# EasyEDA Pro project 2023新生开发板（小组）.eprj, board PCB2
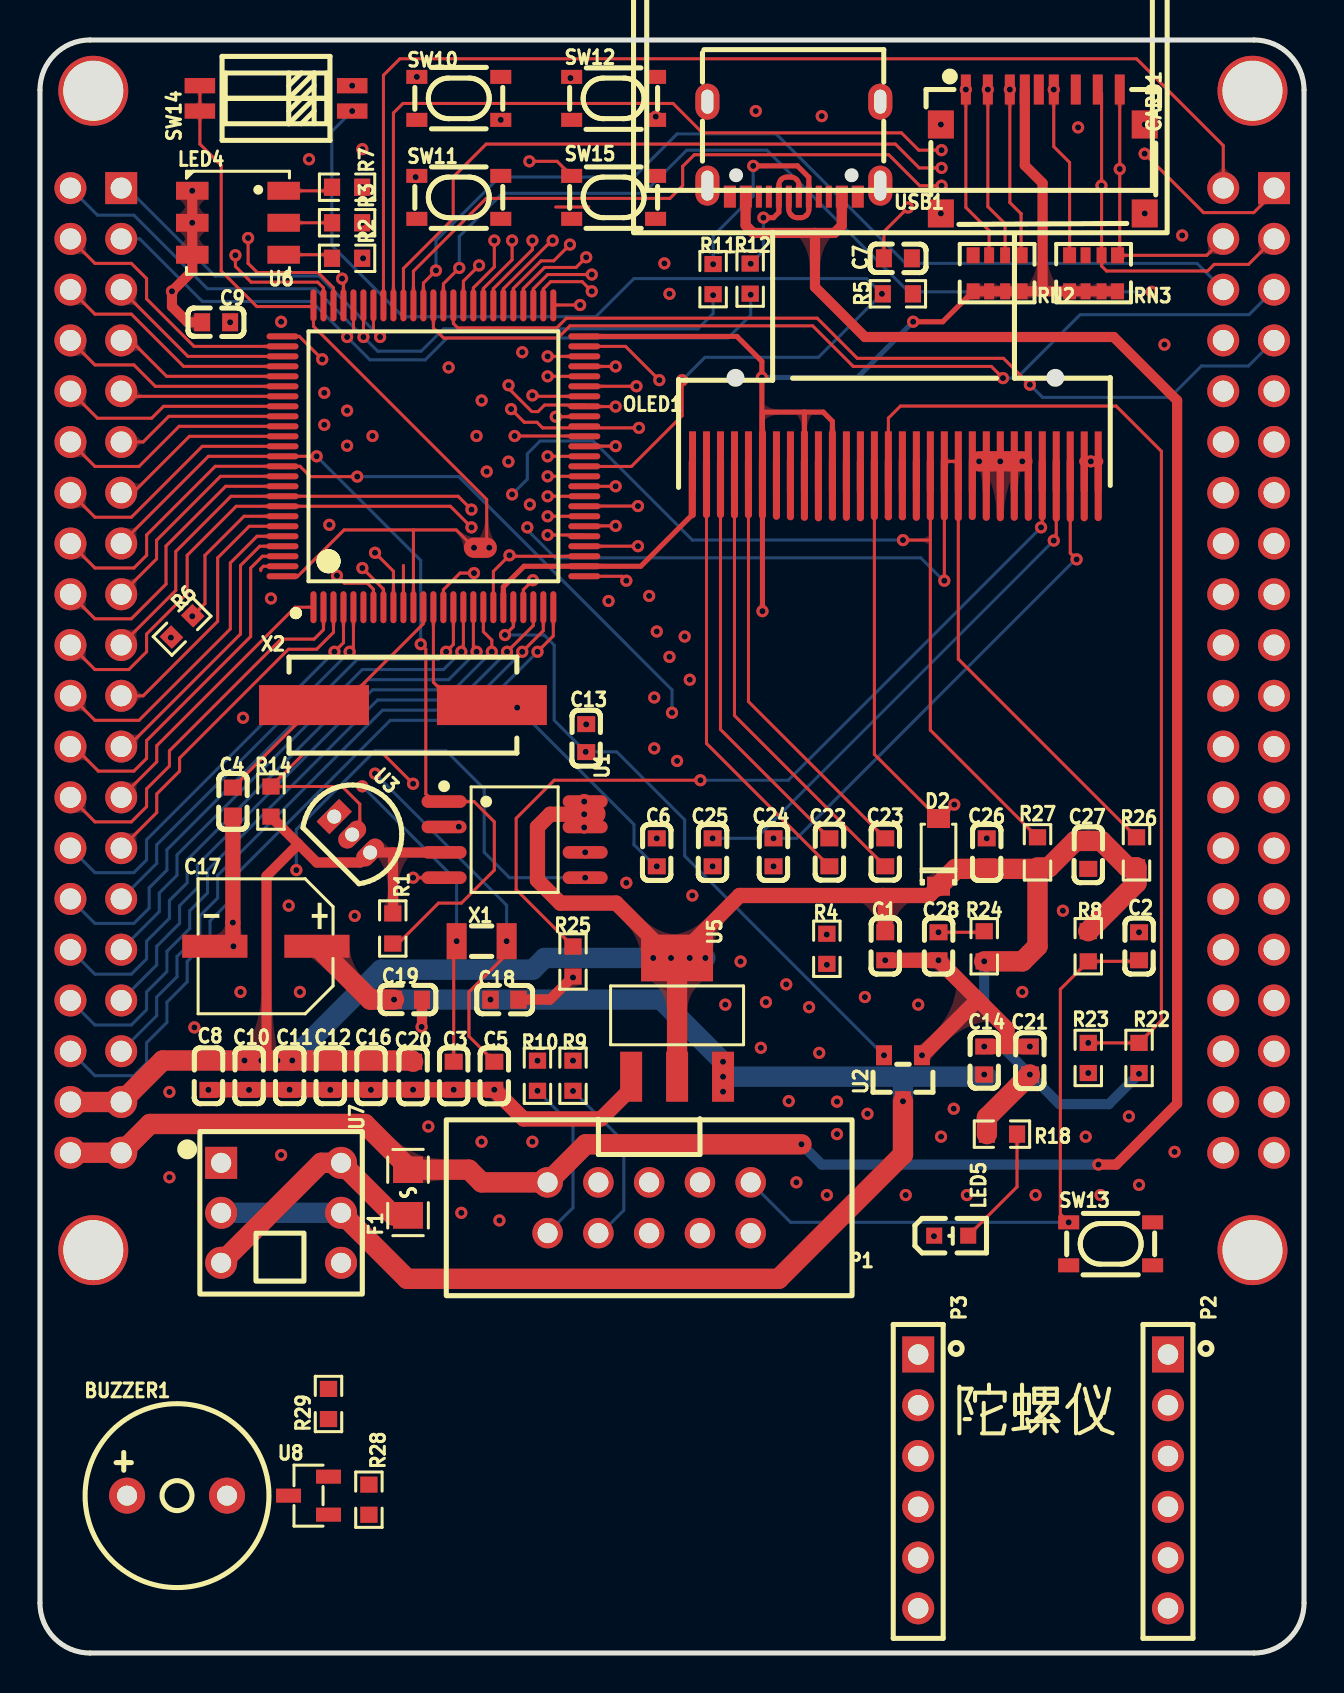
[diagram p2: board, top side]
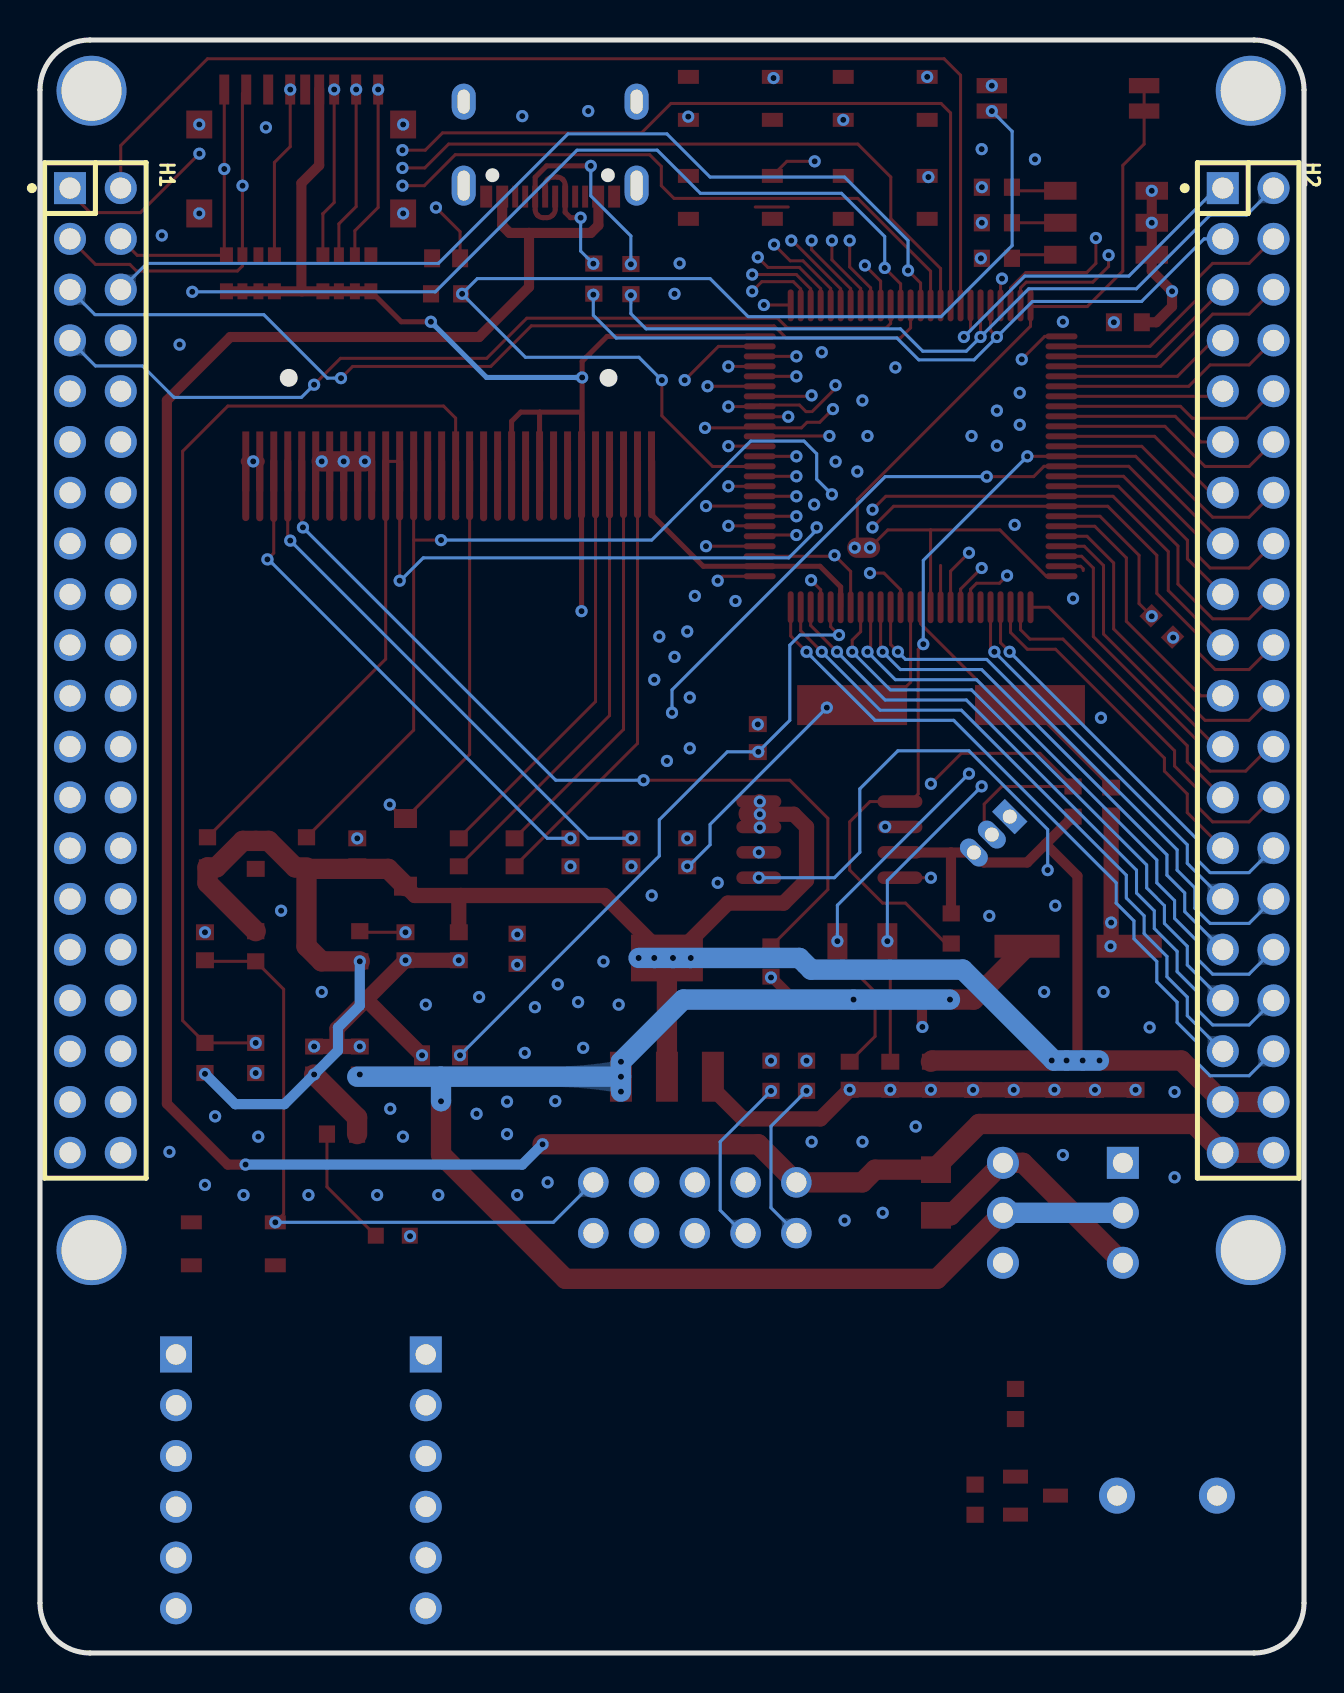
[diagram p3: board, bottom side, seen from below]

Outline 63.25 x 80.7 mm; copper layers: Top Layer, Inner1, Inner2, Bottom Layer. Coordinates in mm from the lower left corner of the outline.
Outline path: 0,78.2 0,2.5 arc(0.73,0.73) 2.5,0 60.75,0 arc(62.51,0.73) 63.25,2.5 63.25,78.2 arc(62.51,79.96) 60.75,80.7 2.5,80.7 arc(0.73,79.96) 0,78.2
Stack: Top Layer 0.035mm 外层铜厚1oz / Dielectric1 0.2104mm 7628 RC49% 8.6mil / Inner1 0.0152mm 内层铜厚 / Dielectric2 1.065mm 1.1mm H/HOZ 含铜 / Inner2 0.0152mm 内层铜厚 / Dielectric3 0.2104mm 7628 RC49% 8.6mil / Bottom Layer 0.035mm 外层铜厚1oz

## Design rules (mm)
template: JLCPCB Capability(Two Layers Board)
spacing copperThickness1oz (default): track to track 0.102, other pairs 0.152 to 0.3
spacing copperThickness2oz: track to track 0.203, other pairs 0.152 to 0.3
track width copperThickness1oz (default): min 0.127, default 0.254, max 2.54
track width copperThickness2oz: min 0.203, default 0.254, max 2.54
differential pair differentialPair (default): width min 0.127, default 0.254, max 2.54; gap min 0.152, default 0.152
via viaSize (default): diameter min 0.5, default 0.61, max 10; hole min 0.3, default 0.305, max 6.3

## Placement (name value [footprint] x y rotation side)
BUZZER1  3kHz  [BUZ-TH_BD9.0-P5.00-D0.6-FD]  6.86 7.87 0 top
C1  100nF  [C0603]  42.29 35.36 270 top
C2  100nF  [C0603]  54.99 35.36 270 top
C3  12pF  [C0603]  20.7 28.88 90 top
C4  20pF  [C0603]  9.65 42.6 270 top
C5  12pF  [C0603]  22.73 28.88 90 top
C6  20pF  [C0603]  30.86 40.06 90 top
C7  1uF  [C0603]  42.93 69.77 180 top
C8  100nF  [C0603]  8.43 28.87 270 top
C9  1uF  [C0603]  8.81 66.57 0 top
C10  100nF  [C0603]  10.46 28.87 270 top
C11  100nF  [C0603]  12.49 28.87 270 top
C12  100nF  [C0603]  14.53 28.87 270 top
C13  100nF  [C0603]  27.33 45.77 90 top
C14  1uF  [C0603]  47.24 29.64 270 top
C16  100nF  [C0603]  16.56 28.87 270 top
C17  220uF  [CAP-SMD_BD6.3-L6.6-W6.6-LS7.2-R-RD]  11.3 35.36 0 top
C18  1uF  [C0603]  23.24 32.69 180 top
C19  100nF  [C0603]  18.41 32.69 0 top
C20  1uF  [C0603]  18.67 28.88 90 top
C21  100nF  [C0603]  49.53 29.64 90 top
C22  1uF  [C0603]  39.5 40.06 270 top
C23  1uF  [C0603]  42.29 40.06 270 top
C24  2.2uF  [C0603]  36.7 40.06 90 top
C25  4.7uF  [C0603]  33.66 40.06 90 top
C26  1uF  [C0603]  47.37 40.06 90 top
C27  1uF  [C0603]  52.45 39.93 270 top
C28  4.7uF  [C0603]  44.96 35.36 270 top
CARD1  XKTF-0803-0  [TF-SMD_XKTF-0803-0]  50.18 75.12 180 top
D2  1N4148W  [SOD-123_L2.8-W1.8-LS3.7-RD]  44.96 40.06 90 top
F1  BSMD0805-020-30V  [F0805]  18.41 23.04 90 top
H1  X6521WV-2x20H-C60D30  [HDR-TH_40P-2.54-V-M-R2-C20-S2.54]  60.47 49.16 270 bottom
H2  X6521WV-2x20H-C60D30  [HDR-TH_40P-2.54-V-M-R2-C20-S2.54]  2.79 49.16 270 bottom
LED4  MHP5050RGBDT  [LED-ARRAY-SMD_6P-L5.0-W5.0-TR-RD]  9.91 71.55 0 top
LED5  NCD0603R3  [LED0603-R-RD_RED]  45.59 20.88 0 top
NOREF  -  [Pad_e168]  60.67 20.16 0 top
NOREF#2  -  [Pad_e167]  60.67 78.16 0 top
NOREF#3  -  [Pad_e166]  2.67 20.16 0 top
NOREF#4  -  [Pad_e164]  2.67 78.16 0 top
OLED1  N096-2864KSWEG01-H30  [OLED_0.96-30P-P0.70-12864]  42.8 59.61 0 top
P1  2.54-2*5P简牛  [IDC-TH_10P-P2.54_C5665]  30.48 22.28 180 top
P2  2.54-1*6P母  [HDR-TH_6P-P2.54-V-F]  56.44 8.59 270 top
P3  2.54-1*6P母  [HDR-TH_6P-P2.54-V-F]  43.94 8.59 270 top
R1  10kΩ  [R0603]  17.65 36.25 270 top
R2  220Ω  [R0603]  15.37 69.77 180 top
R3  220Ω  [R0603]  15.37 71.55 180 top
R4  20Ω  [R0603]  39.37 35.23 90 top
R5  10kΩ  [R0603]  42.93 68 0 top
R6  10kΩ  [R0603]  7.11 51.36 225 top
R7  470Ω  [R0603]  15.37 73.33 180 top
R8  10kΩ  [R0603]  52.45 35.36 270 top
R9  20Ω  [R0603]  26.67 28.88 90 top
R10  20Ω  [R0603]  24.89 28.88 270 top
R11  20Ω  [R0603]  33.68 68.73 90 top
R12  20Ω  [R0603]  35.53 68.76 90 top
R14  10K  [R0603]  11.56 42.6 270 top
R18  470Ω  [R0603]  48.13 25.96 0 top
R22  4.7K  [R0603]  54.99 29.77 270 top
R23  4.7K  [R0603]  52.45 29.77 90 top
R24  4.7K  [R0603]  47.24 35.36 270 top
R25  910K  [R0603]  26.67 34.59 90 top
R26  4.7K  [R0603]  54.86 40.06 90 top
R27  4.7K  [R0603]  49.91 40.06 90 top
R28  4.7K  [R0603]  16.46 7.67 270 top
R29  10K  [R0603]  14.44 12.46 90 top
RN2  10kΩ  [RES-ARRAY-SMD_0603-8P-L3.2-W1.6-BL]  47.89 69.02 0 top
RN3  10kΩ  [RES-ARRAY-SMD_0603-8P-L3.2-W1.6-BL]  52.72 69.02 0 top
SW10  SKRPACE010  [KEY-SMD_4P-L4.2-W3.2-P2.20-LS4.6]  20.96 77.78 180 top
SW11  SKRPACE010  [KEY-SMD_4P-L4.2-W3.2-P2.20-LS4.6]  20.96 72.82 0 top
SW12  SKRPACE010  [KEY-SMD_4P-L4.2-W3.2-P2.20-LS4.6]  28.7 77.78 0 top
SW13  SKRPACE010  [KEY-SMD_4P-L4.2-W3.2-P2.20-LS4.6]  53.57 20.47 0 top
SW14  DSHP02TSGET  [SW-SMD_4P_DSHP02TSGET]  11.81 77.78 90 top
SW15  SKRPACE010  [KEY-SMD_4P-L4.2-W3.2-P2.20-LS4.6]  28.7 72.82 0 top
U1  W25Q16JVSSIQ  [SOIC-8_L5.3-W5.3-P1.27-LS8.0-BL]  23.75 40.69 270 top
U2  PJ75AL33SA  [SOT-23_L2.9-W1.3-P1.90-LS2.4-BR]  43.18 28.75 90 top
U3  DS18B20  [TO-92-3_L4.9-W3.7-P1.27-L]  15.62 40.95 315 top
U5  AMS1117-3.3  [SOT-223-3_L6.5-W3.4-P2.30-LS7.0-BR]  31.88 31.8 270 top
U6  STM32F407VET6  [LQFP-100_L14.0-W14.0-P0.50-LS16.0-BL]  19.69 59.87 0 top
U7  PB-22E08  [SW-TH_6P-L8.0-W8.0-P2.50_PB-22E08]  12.06 22.02 270 top
U8  SS8050  [SOT-23-3_L2.9-W1.3-P1.90-LS2.4-BR]  13.44 7.87 0 top
USB1  TYPE-C 16PIN 2MD(073)  [USB-C-SMD_TYPE-C-6PIN-2MD-073]  37.72 75.23 180 top
X1  32.768kHz  [FC-135R_L3.2-W1.5]  22.1 35.61 180 top
X2  8MHz  [CRYSTAL-SMD_L11.5-W4.8-LS12.7]  18.16 47.42 0 top

## Footprints (pads in the part's own frame, mm; a bottom-side part is the same pattern mirrored in y, then rotated)
BUZ-TH_BD9.0-P5.00-D0.6-FD
  round 1.8 hole 1: 1(-2.5,0) 2(2.5,0)
C0603
  rect 0.8x0.9 smd: 1(-0.7,0) 2(0.7,0)
CAP-SMD_BD6.3-L6.6-W6.6-LS7.2-R-RD
  rect 3.26x1.15 smd: 1(2.555,0) 2(-2.555,0)
CRYSTAL-SMD_L11.5-W4.8-LS12.7
  rect 5.5x2 smd: 1(-4.45,0) 2(4.45,0)
F0805
  rect 1.335x1.5 smd: 1(-1.143,0) 2(1.143,0)
FC-135R_L3.2-W1.5
  rect 1x1.8 smd: 1(-1.25,0) 2(1.25,0)
HDR-TH_6P-P2.54-V-F
  rect 1.8x1.6 hole 1.02: 1(-6.35,0)
  round 1.6 hole 1.02: 2(-3.81,0) 3(-1.27,0) 4(1.27,0) 5(3.81,0) 6(6.35,0)
HDR-TH_40P-2.54-V-M-R2-C20-S2.54
  rect 1.6x1.6 hole 1.05: 1(-24.13,-1.27)
  round 1.6 hole 1.05: 2(-24.13,1.27) 3(-21.59,-1.27) 4(-21.59,1.27) 5(-19.05,-1.27) 6(-19.05,1.27) 7(-16.51,-1.27) 8(-16.51,1.27) 9(-13.97,-1.27) 10(-13.97,1.27) 11(-11.43,-1.27) 12(-11.43,1.27) 13(-8.89,-1.27) 14(-8.89,1.27) 15(-6.35,-1.27) 16(-6.35,1.27) 17(-3.81,-1.27) 18(-3.81,1.27) 19(-1.27,-1.27) 20(-1.27,1.27) 21(1.27,-1.27) 22(1.27,1.27) 23(3.81,-1.27) 24(3.81,1.27) 25(6.35,-1.27) 26(6.35,1.27) 27(8.89,-1.27) 28(8.89,1.27) 29(11.43,-1.27) 30(11.43,1.27) 31(13.97,-1.27) 32(13.97,1.27) 33(16.51,-1.27) 34(16.51,1.27) 35(19.05,-1.27) 36(19.05,1.27) 37(21.59,-1.27) 38(21.59,1.27) 39(24.13,-1.27) 40(24.13,1.27)
IDC-TH_10P-P2.54_C5665
  round 1.524 hole 1: 1(-5.08,-1.27) 2(-5.08,1.27) 3(-2.54,-1.27) 4(-2.54,1.27) 5(0,-1.27) 6(0,1.27) 7(2.54,-1.27) 8(2.54,1.27) 9(5.08,-1.27) 10(5.08,1.27)
KEY-SMD_4P-L4.2-W3.2-P2.20-LS4.6
  rect 1.05x0.7 smd: 1(-2.1,1.075) 2(2.1,1.075) 3(-2.1,-1.075) 4(2.1,-1.075)
LED0603-R-RD_RED
  rect 0.8x0.8 smd: 1(0.851,0) 2(-0.851,0)
LED-ARRAY-SMD_6P-L5.0-W5.0-TR-RD
  rect 1.625x0.896 smd: 1(2.288,1.6) 2(-2.288,1.6) 3(2.288,0) 4(-2.288,0) 5(2.288,-1.6) 6(-2.288,-1.6)
LQFP-100_L14.0-W14.0-P0.50-LS16.0-BL
  oval 0.3x1.6 smd: 1(-6,-7.55) 2(-5.5,-7.55) 3(-5,-7.55) 4(-4.5,-7.55) 5(-4,-7.55) 6(-3.5,-7.55) 7(-3,-7.55) 8(-2.5,-7.55) 9(-2,-7.55) 10(-1.5,-7.55) 11(-1,-7.55) 12(-0.5,-7.55) 13(0,-7.55) 14(0.5,-7.55) 15(1,-7.55) 16(1.5,-7.55) 17(2,-7.55) 18(2.5,-7.55) 19(3,-7.55) 20(3.5,-7.55) 21(4,-7.55) 22(4.5,-7.55) 23(5,-7.55) 24(5.5,-7.55) 25(6,-7.55) 51(6,7.55) 52(5.5,7.55) 53(5,7.55) 54(4.5,7.55) 55(4,7.55) 56(3.5,7.55) 57(3,7.55) 58(2.5,7.55) 59(2,7.55) 60(1.5,7.55) 61(1,7.55) 62(0.5,7.55) 63(0,7.55) 64(-0.5,7.55) 65(-1,7.55) 66(-1.5,7.55) 67(-2,7.55) 68(-2.5,7.55) 69(-3,7.55) 70(-3.5,7.55) 71(-4,7.55) 72(-4.5,7.55) 73(-5,7.55) 74(-5.5,7.55) 75(-6,7.55)
  oval 1.6x0.3 smd: 26(7.55,-6) 27(7.55,-5.5) 28(7.55,-5) 29(7.55,-4.5) 30(7.55,-4) 31(7.55,-3.5) 32(7.55,-3) 33(7.55,-2.5) 34(7.55,-2) 35(7.55,-1.5) 36(7.55,-1) 37(7.55,-0.5) 38(7.55,0) 39(7.55,0.5) 40(7.55,1) 41(7.55,1.5) 42(7.55,2) 43(7.55,2.5) 44(7.55,3) 45(7.55,3.5) 46(7.55,4) 47(7.55,4.5) 48(7.55,5) 49(7.55,5.5) 50(7.55,6) 76(-7.55,6) 77(-7.55,5.5) 78(-7.55,5) 79(-7.55,4.5) 80(-7.55,4) 81(-7.55,3.5) 82(-7.55,3) 83(-7.55,2.5) 84(-7.55,2) 85(-7.55,1.5) 86(-7.55,1) 87(-7.55,0.5) 88(-7.55,0) 89(-7.55,-0.5) 90(-7.55,-1) 91(-7.55,-1.5) 92(-7.55,-2) 93(-7.55,-2.5) 94(-7.55,-3) 95(-7.55,-3.5) 96(-7.55,-4) 97(-7.55,-4.5) 98(-7.55,-5) 99(-7.55,-5.5) 100(-7.55,-6)
OLED_0.96-30P-P0.70-12864
  rect 0.35x3 smd: 1(-10.15,0.003) 2(-9.45,0.001) 3(-8.75,0.001) 4(-8.05,0.001) 5(-7.35,0.001) 6(-6.65,0.001) 7(-5.95,0.001) 8(-5.25,0.001) 9(-4.55,0.001) 10(-3.85,0.001) 11(-3.15,0.001) 12(-2.45,0.001) 13(-1.75,0.001) 14(-1.05,0.001) 15(-0.35,0.001) 16(0.35,0.001) 17(1.05,0.001) 18(1.75,0.001) 19(2.45,0.001) 20(3.15,0.001) 21(3.85,0.001) 22(4.55,0.001) 23(5.25,0.001) 24(5.95,0.001) 25(6.65,0.001) 26(7.35,0.001) 27(8.05,0.001) 28(8.75,-0.002) 29(9.45,-0.003) 30(10.15,-0.003)
Pad_e164
  round 3.5 hole 3: NC(0,0)
Pad_e166
  round 3.5 hole 3: NC(0,0)
Pad_e167
  round 3.5 hole 3: NC(0,0)
Pad_e168
  round 3.5 hole 3: NC(0,0)
R0603
  rect 0.806x0.864 smd: 1(-0.753,0) 2(0.753,0)
RES-ARRAY-SMD_0603-8P-L3.2-W1.6-BL
  rect 0.65x0.8 smd: 1(-1.2,-0.9) 4(1.2,-0.9) 5(1.2,0.9) 8(-1.2,0.9)
  rect 0.5x0.8 smd: 2(-0.4,-0.9) 3(0.4,-0.9) 6(0.4,0.9) 7(-0.4,0.9)
SOD-123_L2.8-W1.8-LS3.7-RD
  rect 0.95x1.15 smd: 1(-1.692,0) 2(1.692,0)
SOIC-8_L5.3-W5.3-P1.27-LS8.0-BL
  oval 0.63x2.25 smd: 1(-1.905,-3.53) 2(-0.635,-3.53) 3(0.635,-3.53) 4(1.905,-3.53) 5(1.905,3.53) 6(0.635,3.53) 7(-0.635,3.53) 8(-1.905,3.53)
SOT-23-3_L2.9-W1.3-P1.90-LS2.4-BR
  rect 1.25x0.7 smd: 1(1,-0.95) 2(1,0.95) 3(-1,0)
SOT-23_L2.9-W1.3-P1.90-LS2.4-BR
  rect 1x0.8 smd: 1(1.15,-0.95) 2(1.15,0.95) 3(-1.15,0)
SOT-223-3_L6.5-W3.4-P2.30-LS7.0-BR
  rect 2.5x1.1 smd: 1(2.97,-2.3) 2(2.97,0) 3(2.97,2.3)
  rect 2.34x3.6 smd: 4(-2.97,0)
SW-SMD_4P_DSHP02TSGET
  rect 0.762x1.524 smd: 1(-0.635,-3.81) 2(0.635,-3.81) 3(0.635,3.81) 4(-0.635,3.81)
SW-TH_6P-L8.0-W8.0-P2.50_PB-22E08
  rect 1.6x1.6 hole 1: 1(-2.5,-3)
  round 1.6 hole 1: 2(0,-3) 3(2.5,-3) 4(-2.5,3) 5(0,3) 6(2.5,3)
TF-SMD_XKTF-0803-0
  rect 0.5x1.5 smd: 1(3.85,-3.1) 2(2.75,-3.1) 3(1.65,-3.1) 4(0.9,-3.1) 5(-0.55,-3.1) 6(-1.65,-3.1) 7(-2.75,-3.1) 8(-3.85,-3.1) 9(0.2,-3.1)
  rect 1.3x1.4 smd: 10(-5.1,-1.35) 11(-5.1,3.1) 12(5.1,3.1) 13(5.1,-1.35)
TO-92-3_L4.9-W3.7-P1.27-L
  rect 0.9x1.6 hole 0.7: 1(-1.27,0)
  oval 0.9x1.6 hole 0.7: 2(0,0) 3(1.27,0)
USB-C-SMD_TYPE-C-6PIN-2MD-073
  rect 0.6x1.1 smd: 1(-3.2,2.375) 2(-2.4,2.375) 11(2.4,2.375) 12(3.2,2.375)
  rect 0.3x1.1 smd: 3(-1.75,2.375) 4(-1.25,2.375) 5(-0.75,2.375) 6(-0.25,2.375) 7(0.25,2.375) 8(0.75,2.375) 9(1.25,2.375) 10(1.75,2.375)
  oval 1.2x2 hole 0.6x1.5: 13(-4.325,1.825) 14(4.325,1.825)
  oval 1.2x1.8 hole 0.6x1.2: 13(-4.325,-2.375) 14(4.325,-2.375)

## Nets
3V3: BUZZER1.1 C1.1 C8.1 C10.1 C11.1 C12.1 C16.1 C20.2 C21.1 C26.1 C27.1 CARD1.4 D2.1 H2.37 H2.38 OLED1.6 OLED1.9 OLED1.11 R1.1 R8.1 R14.2 R18.1 R22.2 R24.2 R26.1 R27.1 RN2.1 RN2.2 RN2.3 RN2.4 RN3.1 RN3.2 RN3.3 RN3.4 SW14.3 SW14.4 U1.3 U1.7 U1.8 U3.3 U5.2 U5.4 U6.11 U6.19 U6.22 U6.28 U6.50 U6.75 U6.100
+5V: C14.2 C17.1 C18.2 C19.1 P3.5 U2.3 U5.3 U7.2 U7.5
GND: C1.2 C2.1 C3.1 C4.2 C5.1 C6.2 C7.1 C8.2 C9.1 C10.2 C11.2 C12.2 C13.2 C14.1 C16.2 C17.2 C18.1 C19.2 C20.1 C21.2 C24.1 C25.1 C26.2 C27.2 C28.2 CARD1.6 CARD1.10 CARD1.11 CARD1.12 CARD1.13 H1.39 H1.40 LED4.2 LED4.4 LED4.6 LED5.2 OLED1.1 OLED1.8 OLED1.10 OLED1.12 OLED1.13 OLED1.16 OLED1.17 OLED1.21 OLED1.22 OLED1.23 OLED1.24 OLED1.25 OLED1.29 OLED1.30 P1.5 P1.6 P3.2 R5.2 R6.2 R23.1 R25.1 R29.2 SW10.4 SW11.4 SW12.4 SW13.4 SW15.4 U1.4 U2.1 U3.1 U5.1 U6.10 U6.20 U6.27 U6.74 U6.99 U8.2 USB1.1 USB1.12 USB1.13 USB1.14
VBAT: U6.6
VIN: F1.2 H2.39 H2.40 P1.9 USB1.2 USB1.11
BOOT0: R6.1 SW14.2 U6.94
BOOT1: R5.1 SW14.1 U6.37
BUZZER: R28.1 R29.1
DS18B20: R14.1 U3.2 U6.7
FLASH_CS: H2.15 R1.2 U1.1 U6.88
I2C2_SCL: P3.4
I2C2_SDA: P3.3
KEY0: H2.30 SW10.1 U6.15
KEY1: H2.31 SW11.1 U6.16
KEY2: H2.32 SW12.1 U6.17
KEY3: H2.33 SW15.1 U6.18
NRST: C2.2 P1.1 R8.2 SW13.1 U6.14
PA0: H2.34 U6.23
PA1: H2.35 U6.24
PA2: H2.36 U6.25
PA3: H1.37 U6.26
PA4: H1.38 U6.29
PA5: H1.35 U6.30
PA6: H1.36 U6.31
PA7: H1.33 U6.32
PA8: H1.1 U6.67
PA9: H1.2 R9.2 U6.68
PA10: H2.1 R10.1 U6.69
PA11: H2.2 R11.1 U6.70
PA12: H2.3 R12.1 U6.71
PA13: P1.4 U6.72
PA14: P1.2 U6.76
PA15: H2.4 U6.77
PB0: H1.32 U6.35
PB1: H1.29 U6.36
PB3: H2.16 R4.2 U6.89
PB4: H2.17 U1.2 U6.90
PB5: H2.18 U1.5 U6.91
PB6: H2.19 OLED1.18 R27.2 U6.92
PB7: H2.20 OLED1.19 OLED1.20 R26.2 U6.93
PB8: H2.21 U6.95
PB9: H2.22 U6.96
PB10: H1.19 U6.47
PB11: H1.20 U6.48
PB12: H1.17 U6.51
PB13: H1.18 U6.52
PB14: H1.15 U6.53
PB15: H1.16 U6.54
PC4: H1.34 U6.33
PC5: H1.31 U6.34
PC6: H1.5 U6.63
PC7: H1.6 U6.64
PC8: CARD1.7 H1.3 RN3.6 U6.65
PC9: CARD1.8 H1.4 RN3.5 U6.66
PC10: CARD1.1 H2.5 RN2.7 U6.78
PC11: CARD1.2 H2.6 RN2.6 U6.79
PC12: CARD1.5 H2.7 RN3.8 U6.80
PD0: H2.8 U6.81
PD1: H2.9 U6.82
PD2: CARD1.3 H2.10 RN2.5 U6.83
PD3: H2.11 U6.84
PD4: H2.12 U6.85
PD5: H2.13 U6.86
PD6: H2.14 U6.87
PD8: H1.13 U6.55
PD9: H1.14 U6.56
PD10: H1.11 U6.57
PD11: H1.12 U6.58
PD12: H1.9 U6.59
PD13: H1.10 U6.60
PD14: H1.7 U6.61
PD15: H1.8 U6.62
PE0: H2.23 U6.97
PE1: H2.24 U6.98
PE2: H2.25 U6.1
PE3: H2.26 U6.2
PE4: H2.27 U6.3
PE5: H2.28 U6.4
PE6: H2.29 U6.5
PE7: H1.30 U6.38
PE8: H1.27 U6.39
PE9: H1.28 U6.40
PE10: H1.25 R2.1 U6.41
PE11: H1.26 U6.42
PE12: H1.23 R7.1 U6.43
PE13: H1.24 U6.44
PE14: H1.21 U6.45
PE15: H1.22 R3.1 U6.46
$1N1693: C6.1 U6.13 X2.2
$1N1695: C4.1 U6.12 X2.1
$1N1697: C5.2 U6.9 X1.1
$1N1698: C3.2 U6.8 X1.2
$1N1844: C13.1 U2.2 U6.21
$1N1845: C7.2 U6.49
$1N1846: C9.2 U6.73
$1N3154: R11.2 USB1.5 USB1.7
$1N3155: R12.2 USB1.6 USB1.8
$1N3177: R4.1 U1.6
$1N3189: P1.8 R9.1
$1N3192: LED5.1 R18.2
$1N3201: P1.10 R10.2
$1N5487: LED4.3 R3.2
$1N5507: LED4.1 R7.2
$1N5508: LED4.5 R2.2
$1N15506: C22.2 OLED1.2
$1N15507: C22.1 OLED1.3
$1N15508: C23.2 OLED1.4
$1N15509: C23.1 OLED1.5
$1N15524: C24.2 OLED1.28
$1N15525: C25.2 OLED1.27
$1N15526: OLED1.26 R25.2
$1N15542: OLED1.15 R22.1 R23.2
$1N15550: C28.1 D2.2 OLED1.14 R24.1
$1N15594: F1.1 U7.3 U7.4
$1N24080: BUZZER1.2 U8.3
$1N24105: R28.2 U8.1

Pads without a net: CARD1 9; NOREF NC; NOREF#2 NC; NOREF#3 NC; NOREF#4 NC; OLED1 7; P1 3 7; P2 1 2 3 4 5 6; P3 1 6; RN2 8; RN3 7; SW10 2 3; SW11 2 3; SW12 2 3; SW13 2 3; SW15 2 3; U7 1 6; USB1 3 4 9 10

## Via types
v1: diameter 0.61, hole 0.305, Top Layer to Bottom Layer, 274 vias

## Routing (per net, layer and track width the routed paths; a pad name or vN(x,y) marks a point on that pad's centre or on a via; arc(x,y) is an arc through that point)
3V3: length 294.5
  Top Layer w0.152: U6.28 23.54,54.87 v1(23.49,54.92) ; U6.19 22.69,54.11 23.36,54.79 ; SW14.3 SW14.4 8,75.49 9.07,74.42 9.07,69.14 10.85,67.36 13.63,67.36 U6.75 13.69,66.38 22.35,57.71 22.35,55.47 ; 18.69,56.16 18.67,56.19 15.21,56.19 12.9,53.87 U6.100 ; 18.69,56.16 18.69,56.15 U6.11 ; 18.69,56.16 18.69,56.19 20.83,56.19 v1(21.72,55.3) ; v1(24.66,53.67) 24.19,53.19 U6.22
  Top Layer w0.254: 38.24,62.08 36.15,62.08 OLED1.6 36.12,59.64 v1(36.12,63.81) 36.12,64.62 34.87,65.87 U6.50 ; 38.24,62.08 39.19,62.08 39.65,61.62 39.65,59.62 ; 38.24,62.08 38.25,62.06 OLED1.9 ; v1(43.69,66.6) 45.17,66.6 RN2.1 ; 36.15,56.91 v1(36.15,52.12)
  Top Layer w0.355: OLED1.6 36.15,56.91 ; 39.65,59.62 39.65,56.82 ; OLED1.9 38.25,56.82
  Top Layer w0.508: 50.14,68.12 RN2.4 RN2.3 RN2.2 RN2.1 ; 50.14,68.12 RN3.2 RN3.3 RN3.4 ; 50.14,68.12 50.16,68.14 50.16,73.53 49.28,74.42 CARD1.4 ; 17.66,40.05 17.66,37.01 R1.1 ; 17.66,40.05 16.52,40.05 16.02,39.55 13.85,39.55 12.93,40.47 ; 17.66,40.05 19.29,40.05 19.3,40.06 U1.3 ; 11.34,29.64 11.34,38.87 12.93,40.47 ; 12.93,40.47 R14.2
  Top Layer w0.762: 42.19,37.9 42.29,37.79 C1.1 ; 42.19,37.9 44.49,37.9 D2.1 ; 42.19,37.9 35,37.9 U5.4 v1(31.57,34.77) 28.83,37.52 26.03,37.52 24.89,38.66 24.89,41.33 25.53,41.96 v1(27.23,41.96) v1(27.23,42.6)
  Top Layer w1.016: U5.2 U5.4 ; R27.1 50.48,39.3 51.81,40.63 C27.1 53.1,40.63 54.42,39.3 R26.1 54.86,38.52 R8.1 ; R18.1 47.38,26.79 v1(49.53,28.94) ; 27.79,41.99 27.76,41.96 v1(27.23,41.96) ; D2.1 45.82,39.23 49.91,39.23 49.91,35.36 49.16,34.6 v1(47.24,34.6) ; 22.35,55.3 v1(21.72,55.3) ; C20.2 18.61,29.64 v1(12.62,29.64) v1(11.88,29.64) v1(10.23,29.64) 6.14,29.64 H2.37 H2.38
  Inner1 w0.254: v1(36.15,52.12) 30.27,52.12 28.28,50.13
  Inner1 w1.016: v1(21.72,55.3) v1(22.48,55.3) 23.11,55.3 v1(23.49,54.92) 29.46,48.95 29.46,45.01 27.23,42.77 v1(27.23,41.96) v1(27.23,41.3)
  Bottom Layer w0.254: v1(36.12,63.81) 40.9,63.81 v1(43.69,66.6)
  Bottom Layer w0.508: v1(54.99,28.97) 53.47,27.46 51.01,27.46 v1(49.53,28.94) 48.34,30.14 48.34,31.29 47.24,32.39 v1(47.24,34.6)
  Bottom Layer w1.016: 10.26,29.64 v1(11.08,29.64) v1(11.88,29.64) 12.52,29.64 17.07,34.19 24.66,34.19 25.25,34.77 v1(30.68,34.77) v1(31.57,34.77) v1(32.51,34.77) v1(33.29,34.77)
+5V: length 79.4
  Top Layer w1.016: U7.5 18.37,18.72 36.96,18.72 43.18,24.94 v1(43.18,27.6) ; C17.1 16.53,32.69 v1(17.72,32.69)
  Bottom Layer w1.016: U7.2 U7.5 ; v1(34.18,28.83) v1(34.18,29.58) 31.06,32.69 v1(22.54,32.69) v1(17.72,32.69) ; v1(34.18,28.83) v1(34.18,28.08) ; v1(34.18,28.83) 43.19,28.83 ; 43.19,28.83 43.18,28.82 v1(43.18,27.6) ; 43.19,28.83 47.37,28.83
  vias: v1(47.24,28.94)
GND: length 128
  Top Layer w0.152: 25.81,72.34 27.46,72.34 ; U6.99 11.18,54.37 11.05,54.24 11.05,54.15 ; v1(9.78,69.93) 9.78,69.37 10.57,68.58 13.9,68.58 14.19,68.29 U6.74 ; U1.4 v1(18.67,38.79) ; U6.10 18.19,54.41
  Top Layer w0.254: 32.64,59.61 OLED1.1 ; 32.64,56.95 30.06,54.37 U6.27 24.22,54.37 23.19,53.34 U6.20
  Top Layer w0.355: v1(48.05,59.61) 48.05,56.8 ; OLED1.10 38.95,56.79 ; 32.64,59.61 32.64,56.95 ; OLED1.13 41.05,56.79 ; v1(49.15,59.61) 49.45,59.31 49.45,56.82 ; OLED1.16 43.15,56.85 43.15,56.85 ; OLED1.12 40.35,56.82 ; OLED1.21 46.65,56.86 ; OLED1.24 48.75,56.82 ; OLED1.17 43.85,56.82 ; OLED1.22 47.35,56.82 ; OLED1.29 52.25,56.79 ; OLED1.8 37.55,56.85 ; OLED1.30 52.95,56.8
  Top Layer w0.508: C18.1 25.52,32.69 R25.1 ; v1(7.62,73.15) v1(7.62,71.55) LED4.6 7.62,69.14 v1(6.6,68.12) 6.6,67.36 7.39,66.57 C9.1 ; v1(19.1,31.32) 19.12,31.34 C19.2 ; OLED1.29 OLED1.30
  Top Layer w0.762: v1(8.43,28.17) 8.44,28.18 v1(12.49,28.18) v1(18.67,28.18) v1(20.7,28.18) v1(22.73,28.18) 24.19,26.72 28.07,26.72 29.58,28.23 U5.1 ; 48.39,30.34 48.39,31.23 46.9,32.71 ; 48.39,30.34 v1(49.53,30.34) ; 48.39,30.34 v1(47.24,30.34) ; v1(44.13,29.9) 46.9,32.68 46.9,32.71 ; C17.2 9.65,35.36 v1(9.65,36.54) C4.2 ; v1(42.29,34.66) v1(44.96,34.66) 46.9,32.71
  Top Layer w1.016: v1(46.99,59.61) OLED1.22 v1(48.05,59.61) OLED1.24 v1(49.15,59.61)
  Inner2 w1.524: 32.23,73.38 32.26,73.41 USB1.14 ; 32.51,77.34 33.13,77.34 USB1.14 34.63,77.61 34.7,77.67
  vias: v1(6.48,28.07) v1(6.48,23.8) v1(6.55,50.8) v1(7.73,31.3) v1(9.68,35.36) v1(10.03,33.07) v1(10.16,46.79) v1(10.46,28.17) v1(11.56,52.76) v1(12.06,66.6) v1(12.06,24.91) v1(12.45,37.39) v1(13,33.07) v1(13.46,74.73) v1(14.22,63.04) v1(14.22,61.44) v1(14.48,56.44) v1(14.53,28.17) v1(15.37,62.15) v1(15.37,60.4) v1(15.75,36.88) v1(16.13,75.23) v1(16.56,28.17) v1(16.64,60.88) v1(18.85,78.85) v1(19.43,26.34) v1(20.45,64.31) v1(21.08,22.02) v1(21.84,60.88) v1(22.1,62.66) v1(22.09,25.58) v1(22.35,59.11) v1(22.99,21.64) v1(23.44,59.6) v1(24.13,65.08) v1(24.51,57.46) v1(24.64,25.58) v1(26.67,33.8) v1(27.33,46.46) v1(28.45,52.63) v1(29.34,38.53) v1(30.48,52.88) v1(30.81,76.86) v1(30.73,47.8) v1(30.73,45.26) v1(30.86,51.11) v1(30.86,40.76) v1(31.24,69.52) v1(31.5,68) v1(31.5,49.84) v1(31.88,44.63) v1(32.26,50.85) v1(32.51,48.69) v1(32.64,37.9) v1(33.66,39.36) v1(34.29,32.44) v1(35.05,34.59) v1(35.81,77.14) v1(36.07,30.28) v1(36.32,32.56) v1(36.7,39.36) v1(37.34,33.45) v1(37.47,27.61) v1(37.85,23.55) v1(38.48,32.31) v1(38.99,30.02) v1(39.12,76.89) v1(39.37,22.91) v1(39.88,27.58) v1(39.88,25.96) v1(41.28,32.82) v1(41.4,26.98) v1(43.32,22.91) v1(43.94,32.44) v1(44.73,20.85) v1(45.08,76.47) v1(45.08,72.02) v1(45.09,25.83) v1(45.72,27.23) v1(46.38,22.91) v1(47.37,40.76) v1(49.15,33.07) v1(49.81,22.91) v1(51.18,37.14) v1(51.94,76.32) v1(52.32,25.83) v1(52.45,29.02) v1(52.58,59.61) v1(53.06,22.91) v1(54.48,26.85) v1(54.99,36.06) v1(54.99,23.42) v1(55.28,76.47) v1(55.28,72.02) v1(56.26,65.46) v1(56.77,25.07) v1(57.15,70.92)
VIN: length 126.1
  Top Layer w0.508: 38.78,71.04 35.69,71.04 35.31,71.43 35.31,72.85 USB1.11 ; 38.78,71.04 38.78,68.34 41.28,65.84 53.72,65.84 56.9,62.66 56.9,27.48 53.85,24.44 v1(52.96,24.44) ; 38.78,71.04 39.75,71.04 40.12,71.41 USB1.2
  Top Layer w1.016: v1(38.1,25.45) 27.31,25.45 P1.9 22.1,23.55 21.46,24.18 F1.2 18.41,24.31 16.26,26.47 5.5,26.47 H2.39 H2.40
  Bottom Layer w0.508: v1(52.96,24.44) 39.12,24.44 v1(38.1,25.45)
(no net): length 2.7
  Top Layer w0.355: OLED1.7 36.85,56.87
BOOT0: length 37.8
  Top Layer w0.152: R6.1 8.25,52.5 8.25,54.92 10.21,56.87 U6.94
  Inner2 w0.152: v1(7.62,51.87) 7.62,70.41 v1(15.62,78.41)
BOOT1: length 56.8
  Top Layer w0.152: v1(32.13,63.68) 32.13,61.9 29.59,59.36 27.24,59.36 U6.37
  Bottom Layer w0.152: v1(15.62,77.14) 14.6,76.12 14.6,70.41 18.16,66.85 27.81,66.85 29.72,68.76 41.36,68.76 v1(42.13,68) 38.95,64.82 33.27,64.82 v1(32.13,63.68)
DS18B20: length 29.9
  Top Layer w0.152: U3.2 16,41.33 16,42.47 15.12,43.35 R14.1 13.22,45.01 17.15,45.01 v1(18.67,43.48) ; v1(14.86,53.9) 15.24,53.52 16.38,53.52 16.69,53.22 U6.7
  Inner1 w0.152: v1(18.67,43.48) 17.78,44.37 17.78,50.98 v1(14.86,53.9)
FLASH_CS: length 43.8
  Top Layer w0.152: v1(13.84,59.87) U6.88 8.43,59.87 H2.15 ; R1.2 17.92,35.49 19.94,37.52 21.08,37.52 22.73,39.17 22.73,41.58 21.72,42.6 U1.1 19.69,42.6 19.3,42.98 19.3,50.22 v1(19.05,50.47)
  Bottom Layer w0.152: v1(19.05,50.47) 19.05,54.66 v1(13.84,59.87)
KEY0: length 60.6
  Top Layer w0.152: v1(20.32,50.09) 20.69,50.45 U6.15
  Inner1 w0.152: v1(23.06,76.7) 18.99,76.7 17.96,75.67 17.96,63.7 19.43,62.23 19.43,50.98 v1(20.32,50.09)
  Bottom Layer w0.152: v1(20.32,50.09) 19.94,49.71 15.88,49.71 6.35,40.18 6.35,39.17 5.46,38.28 5.46,37.26 4.7,36.5 2.75,36.5 H2.30
KEY1: length 51.5
  Top Layer w0.152: U6.16 21.19,50.19 v1(21.08,50.09)
  Inner1 w0.152: v1(21.08,50.09) 19.96,51.21 19.96,62.69 18.59,64.06 18.59,73.64 v1(18.8,73.84)
  Bottom Layer w0.152: v1(21.08,50.09) 20.19,49.2 16.13,49.2 6.86,39.93 6.86,38.91 5.97,38.02 5.97,37.09 H2.31
KEY2: length 64.4
  Top Layer w0.152: U6.17 21.69,50.25 v1(21.84,50.09)
  Inner1 w0.152: v1(26.54,78.79) 26.54,78.41 19.18,71.04 19.18,64.31 20.47,63.02 20.47,51.46 v1(21.84,50.09)
  Bottom Layer w0.152: H2.32 2.75,33.96 4.57,33.96 5.33,34.72 5.33,35.61 6.48,36.75 6.48,37.64 7.37,38.53 7.37,39.68 16.38,48.69 20.45,48.69 v1(21.84,50.09)
KEY3: length 64.3
  Top Layer w0.152: v1(22.61,50.09) 22.61,50.67 22.19,51.09 U6.18 ; SW15.1 25.87,74.63 v1(24.49,74.63)
  Inner1 w0.152: v1(24.49,74.63) 28.57,70.54 28.57,67.74 27.43,66.6 24.26,66.6 20.96,63.3 20.96,51.74 v1(22.61,50.09)
  Bottom Layer w0.152: v1(22.61,50.09) 20.7,48.18 16.64,48.18 7.87,39.42 7.87,38.28 6.98,37.39 6.98,36.5 5.84,35.36 5.84,34.42 H2.33
NRST: length 75.9
  Top Layer w0.152: v1(51.47,21.55) 51.05,21.96 51.05,33.21 R8.2 54.94,34.6 C2.2 ; v1(21.72,54.03) 21.02,54.03 20.19,53.19 U6.14
  Inner1 w0.152: v1(21.72,54.03) 22.48,54.03 25.78,50.72 25.78,27.48 27.69,25.58 33.53,25.58 P1.1
  Bottom Layer w0.152: P1.1 37.56,21.55 v1(51.47,21.55)
PA0: length 35.2
  Top Layer w0.152: U6.23 24.69,51.41 v1(23.37,50.09)
  Bottom Layer w0.152: v1(23.37,50.09) 20.96,47.68 16.89,47.68 8.38,39.17 8.38,38.02 7.49,37.14 7.49,36.25 6.35,35.1 6.35,34.09 5.33,33.07 5.33,32.18 4.57,31.42 2.75,31.42 H2.34
PA1: length 33.3
  Top Layer w0.152: U6.24 25.19,51.14 v1(24.13,50.09)
  Bottom Layer w0.152: v1(24.13,50.09) 21.21,47.17 17.15,47.17 8.89,38.91 8.89,37.77 8,36.88 8,35.99 6.86,34.85 6.86,33.83 5.84,32.82 5.84,31.88 H2.35
PA2: length 38.1
  Top Layer w0.152: v1(24.89,50.09) 25.69,50.88 U6.25
  Bottom Layer w0.152: v1(24.89,50.09) 21.46,46.66 17.53,46.66 9.4,38.53 9.4,37.52 8.51,36.63 8.51,35.74 7.37,34.59 7.37,33.58 6.35,32.56 6.35,31.55 5.33,30.53 5.33,29.52 4.7,28.88 2.75,28.88 H2.36
PA3: length 46.4
  Top Layer w0.152: v1(29.34,53.65) 29.11,53.87 U6.26
  Inner2 w0.152: H1.37 60.52,26.34 58.41,26.34 31.11,53.65 v1(29.34,53.65)
PA4: length 43.5
  Top Layer w0.152: v1(29.92,55.37) 27.24,55.37 U6.29
  Inner2 w0.152: H1.38 58.46,27.57 30.66,55.37 v1(29.92,55.37)
PA5: length 50.2
  Top Layer w0.152: v1(25.4,55.93) 27.17,55.93 U6.30
  Inner2 w0.152: H1.35 60.64,29 58.13,29 31.22,55.91 29.49,55.91 29.07,55.49 25.84,55.49 v1(25.4,55.93)
PA6: length 42.9
  Top Layer w0.152: U6.31 27.25,56.39 v1(28.8,56.39)
  Inner2 w0.152: v1(28.8,56.39) 32.92,56.39 H1.36
PA7: length 49.4
  Top Layer w0.152: U6.32 v1(25.4,56.87)
  Inner2 w0.152: H1.33 61.75,32.56 60.58,31.39 58.65,31.39 33.2,56.85 29.46,56.85 29.31,57 25.53,57 v1(25.4,56.87)
PA8: length 56.8
  Top Layer w0.152: U6.67 17.69,77.05 18.16,77.52 31.67,77.52 33.15,76.05 43.1,76.05 43.97,75.18 v1(45.11,75.18) ; H1.1 61.75,73.07 60.73,72.06 58.22,72.06 v1(55.27,75.01)
  Inner2 w0.152: v1(55.27,75.01) 55.09,75.18 v1(45.11,75.18)
PA9: length 131.6
  Top Layer w0.152: U6.68 17.19,78.93 18.01,79.76 54.86,79.76 59.21,75.42 H1.2
  Inner1 w0.152: H1.2 57.96,72.04 57.96,32.55 56.83,31.42 28.46,31.42 v1(26.67,29.63)
PA10: length 57.2
  Top Layer w0.152: v1(17.02,65.84) 16.69,66.17 U6.69
  Inner1 w0.152: v1(24.89,29.63) 24.89,38.66 18.41,45.14 18.41,62.15 17.02,63.55 v1(17.02,65.84)
  Bottom Layer w0.152: v1(17.02,65.84) 13.97,68.89 8.76,68.89 4.36,73.29 H2.1
PA11: length 38.8
  Top Layer w0.152: U6.70 v1(16.19,65.84)
  Bottom Layer w0.152: H2.2 2.88,71.93 4.7,71.93 8.38,68.25 13.77,68.25 v1(16.19,65.84) 16.9,65.13 19.08,65.13 20.19,66.24 32.92,66.24 33.68,67.01 33.68,67.92
  vias: v1(33.68,67.93)
PA12: length 37.7
  Top Layer w0.152: v1(15.37,65.84) 15.69,66.16 U6.71
  Bottom Layer w0.152: H2.3 5,70.75 8.13,67.62 13.59,67.62 v1(15.37,65.84) 16.51,64.69 19.28,64.69 20.37,65.79 34.42,65.79 35.56,66.93 v1(35.56,67.95)
PA13: length 57.9
  Top Layer w0.152: U6.72 15.19,68.69 v1(15.11,68.76)
  Inner2 w0.152: v1(15.11,68.76) 14.73,68.38 14.73,65.2 18.03,61.9 18.03,42.09 24.51,35.61 24.51,34.59 34.29,24.82 34.29,22.28 P1.4
PA14: length 58.6
  Top Layer w0.152: v1(14.12,64.72) 12.97,65.87 U6.76
  Inner2 w0.152: v1(14.12,64.72) 17.4,61.44 17.4,41.45 22.1,36.75 22.1,35.61 31.75,25.96 31.75,20.5 32.51,19.74 34.29,19.74 P1.2
PA15: length 13.4
  Top Layer w0.152: U6.77 7.71,65.37 5.33,67.74 5.33,68.76 4.57,69.52 2.75,69.52 H2.4
PB0: length 41.7
  Top Layer w0.152: U6.35 28.96,58.37
  Inner2 w0.152: H1.32 58.16,35.19 34.98,58.37 v1(28.8,58.37)
PB1: length 48.2
  Top Layer w0.152: U6.36 v1(25.4,58.87)
  Inner2 w0.152: v1(25.4,58.87) 25.61,59.08 35,59.08 57.61,36.47 60.49,36.47 H1.29
PB3: length 54.2
  Top Layer w0.152: v1(15.88,58.85) 13.53,58.85 13.01,59.37 U6.89 8.77,59.37 5.34,55.93 5.34,54.92 4.7,54.28 2.75,54.28 H2.16
  Inner1 w0.152: v1(39.36,35.95) 38.02,35.95 35.18,38.79 35.18,42.72 31.62,46.28 v1(31.62,47.04)
  Bottom Layer w0.152: v1(31.62,47.04) 31.62,48.18 20.96,58.85 v1(15.88,58.85)
PB4: length 33.5
  Top Layer w0.152: H2.17 5.83,54.74 5.83,55.67 9.03,58.87 U6.90
  Inner1 w0.152: H2.17 5.33,51.7 5.33,50.47 12.57,43.23 15.37,43.23 17.26,41.34 v1(20.96,41.34)
PB5: length 56.8
  Top Layer w0.152: H2.18 2.75,51.74 4.57,51.74 6.31,53.48 6.31,55.38 9.3,58.37 U6.91
  Inner1 w0.152: H2.18 2.79,51.7 2.79,49.84 3.43,49.2 4.7,49.2 12.83,41.07 v1(12.83,39.17)
  Bottom Layer w0.152: v1(27.28,38.79) 23.5,38.79 22.22,40.06 22.22,43.23 20.32,45.14 16.76,45.14 12.83,41.2 v1(12.83,39.17)
PB6: length 70.2
  Top Layer w0.152: 44.55,55.68 v1(43.18,55.68) ; 44.55,55.68 44.55,56.83 ; 44.55,55.68 44.55,46.17 R27.2 ; v1(21.59,57.2) 20.92,57.87 U6.92 9.56,57.87 6.79,55.1 6.79,53.15 H2.19
  Top Layer w0.355: OLED1.18 44.55,56.83
  Inner2 w0.152: v1(21.59,57.2) 22.86,57.2 v1(23.62,57.96)
  Bottom Layer w0.152: v1(23.62,57.96) 24.38,58.73 24.38,60 25.02,60.63 27.69,60.63 32.64,55.68 v1(43.18,55.68)
PB7: length 80
  Top Layer w0.152: R26.2 45.95,49.72 45.95,56.8 ; H2.20 2.75,49.2 4.45,49.2 5.33,50.09 5.33,50.98 7.37,53.01 7.37,54.92 9.82,57.37 U6.93 20.53,57.37 v1(21.59,56.31) ; 45.25,56.83 v1(45.25,53.65) ; OLED1.20 OLED1.19
  Top Layer w0.355: OLED1.19 45.25,56.83 ; OLED1.20 45.95,56.8
  Inner2 w0.152: v1(24.38,56.31) v1(21.59,56.31)
  Bottom Layer w0.152: 45.21,53.65 44.07,54.79 25.78,54.79 24.38,56.19 v1(24.38,56.31)
PB8: length 13.4
  Top Layer w0.152: H2.21 5.16,47.89 8.89,51.61 8.89,54.79 10.47,56.37 U6.95
PB9: length 16.9
  Top Layer w0.152: U6.96 10.86,55.87 9.53,54.53 9.53,51.23 4.95,46.66 2.75,46.66 H2.22
PB10: length 42.7
  Top Layer w0.152: U6.47 27.24,64.36 v1(28.8,64.36)
  Inner2 w0.152: H1.19 61.73,50.43 60.5,49.2 54.36,49.2 37.52,66.04 30.48,66.04 v1(28.8,64.36)
PB11: length 43.1
  Top Layer w0.152: v1(25.4,64.87) U6.48
  Inner2 w0.152: H1.20 54.09,50.43 37.82,66.7 30.25,66.7 28.42,64.87 v1(25.4,64.87)
PB12: length 43.1
  Top Layer w0.152: U6.51 25.7,67.44 v1(27.03,67.44)
  Inner2 w0.152: H1.17 60.47,51.69 53.7,51.69 38.2,67.18 29.97,67.18 29.72,67.44 v1(27.03,67.44)
PB13: length 42
  Top Layer w0.152: v1(27.61,68.12) 27.13,68.61 25.55,68.61 25.19,68.24 U6.52
  Inner2 w0.152: H1.18 56.76,52.97 49.38,60.35 45.87,60.35 37.49,68.73 28.91,68.73 28.3,68.12 v1(27.61,68.12)
PB14: length 45.9
  Top Layer w0.152: U6.53 24.69,68.25 25.4,68.96 v1(27.61,68.96)
  Inner2 w0.152: v1(27.61,68.96) 28.93,70.28 36.75,70.28 46.13,60.91 49.58,60.91 56.29,54.2 60.44,54.2 H1.15
PB15: length 43.3
  Top Layer w0.152: U6.54 24.19,68.25 25.25,69.32 26.82,69.32 v1(27.33,69.83)
  Inner2 w0.152: H1.16 55.8,55.51 49.81,61.49 46.38,61.49 37.01,70.87 28.37,70.87 v1(27.33,69.83)
PC4: length 42.2
  Top Layer w0.152: v1(29.92,57.38) 27.25,57.38 U6.33
  Inner2 w0.152: v1(29.92,57.38) 34.47,57.38 H1.34
PC5: length 48.8
  Top Layer w0.152: U6.34 v1(25.4,57.87)
  Inner2 w0.152: v1(25.4,57.87) 25.55,57.72 29.27,57.72 29.46,57.91 34.75,57.91 58.75,33.91 60.47,33.91 H1.31
PC6: length 46.6
  Top Layer w0.152: v1(48.18,63.78) 47.6,64.36 40.69,64.36 38.66,66.4 26.52,66.4 25.91,65.79 20.19,65.79 19.69,66.29 U6.63
  Bottom Layer w0.152: v1(48.18,63.78) 48.87,63.78 52.04,66.95 60.49,66.95 H1.5
PC7: length 48.3
  Top Layer w0.152: v1(19.81,69.16) 19.19,68.54 U6.64
  Bottom Layer w0.152: v1(19.81,69.16) 19.81,70.66 22.99,73.84 29.72,73.84 31.88,76 36.83,76 43.31,69.52 57.89,69.52 H1.6
PC8: length 58.1
  Top Layer w0.152: CARD1.7 53.12,78.03 RN3.6 53.12,69.39 53.37,69.14 58.42,69.14 58.75,69.47 60.47,69.47 H1.3 ; v1(45.11,73.41) 44.02,73.41 42.47,74.96 32.74,74.96 32.16,74.37 32.16,73.41 31.52,72.77 22.33,72.77 18.69,69.13 U6.65
  Inner2 w0.152: v1(45.11,73.41) v1(53.11,73.41)
PC9: length 56
  Top Layer w0.152: U6.66 18.19,69.26 20.68,71.76 20.68,73.84 22.33,75.49 42.8,75.49 43.99,74.3 v1(45.11,74.3) ; 54.03,78.22 v1(54.03,74.24) 54.03,70.03 RN3.5 58.38,69.92 H1.4
  Inner2 w0.152: v1(54.03,74.24) 53.97,74.3 v1(45.11,74.3)
PC10: length 67.6
  Top Layer w0.152: U6.78 7.4,64.87 H2.5 ; RN2.7 47.49,71.15 46.33,72.32 v1(46.33,78.22)
  Inner2 w0.152: v1(46.33,78.22) 45.12,79.43 11.94,79.43 5.33,72.82 5.33,69.48 H2.5
PC11: length 75.2
  Top Layer w0.152: RN2.6 48.29,71.5 47.43,72.36 v1(47.43,78.22) ; U6.79 7.18,64.37 4.57,66.98 2.75,66.98 H2.6
  Inner2 w0.152: v1(47.43,78.22) 45.58,80.06 8.64,80.06 2.79,74.22 2.79,69.48 H2.6
PC12: length 74.5
  Top Layer w0.152: CARD1.5 v1(50.72,78.22) 50.72,75.36 51.52,74.57 51.52,69.92 ; U6.80 6.34,63.87 4.54,65.67 H2.7
  Inner2 w0.152: v1(50.72,78.22) 50.72,77.83 50.04,77.14 46.23,77.14 44.45,78.92 32.64,78.92 31.94,78.22 17.47,78.22 16.64,79.05 12.57,79.05 6.1,72.57 6.1,68.76 5.46,68.12 5.46,67.06 H2.7
PD0: length 11.6
  Top Layer w0.152: H2.8 2.75,64.44 4.7,64.44 5.77,63.37 U6.81
PD1: length 8.2
  Top Layer w0.152: U6.82 4.32,62.87 H2.9
PD2: length 81.8
  Top Layer w0.152: H2.10 2.88,61.77 5.59,61.77 6.18,62.37 U6.83 ; 49.09,72 49.1,72.01 ; 49.09,72 RN2.5 ; 49.09,72 48.53,72.57 v1(48.53,78.22)
  Inner1 w0.152: v1(48.53,78.22) 47.06,79.68 7.37,79.68 5.72,78.03 5.72,65.46 4.57,64.31 2.79,64.31 1.61,63.13 H2.10
PD3: length 8.6
  Top Layer w0.152: H2.11 5.16,60.59 6.45,61.87 U6.84
PD4: length 12
  Top Layer w0.152: H2.12 2.75,59.36 4.95,59.36 6.96,61.37 U6.85
PD5: length 9.2
  Top Layer w0.152: U6.86 7.48,60.87 4.66,58.05 H2.13
PD6: length 12.6
  Top Layer w0.152: H2.14 2.75,56.82 4.57,56.82 8.12,60.37 U6.87
PD8: length 47.7
  Top Layer w0.152: v1(26.52,70.46) 25.71,69.65 25.07,69.65 23.69,68.26 U6.55
  Inner2 w0.152: v1(26.52,70.46) 27.51,71.45 34.85,71.45 35.87,72.47 36.63,72.47 47.09,62 51.05,62 56.29,56.77 60.47,56.77 H1.13
PD9: length 45
  Top Layer w0.152: U6.56 23.19,68.25 25.6,70.66 v1(25.65,70.66)
  Inner2 w0.152: H1.14 56,58.05 51.38,62.66 48.39,62.66 42.32,68.73 41.2,68.73 36.93,73 35.59,73 34.62,72.03 27.03,72.03 v1(25.65,70.66)
PD10: length 50
  Top Layer w0.152: v1(24.64,70.66) 24.64,70.21 22.69,68.25 U6.57
  Inner2 w0.152: v1(24.64,70.66) 28.96,74.98 35.92,74.98 41.38,69.52 42.52,69.52 47.12,64.92 51.21,64.92 56.84,59.28 60.44,59.28 H1.11
PD11: length 47.5
  Top Layer w0.152: v1(23.62,70.66) 23.62,69.7 22.19,68.26 U6.58
  Inner2 w0.152: v1(23.62,70.66) 28.37,75.41 36.3,75.41 41.6,70.1 42.77,70.1 47.4,65.48 51.56,65.48 56.46,60.59 H1.12
PD12: length 51.2
  Top Layer w0.152: v1(22.73,70.66) 22.73,69.34 21.69,68.29 U6.59
  Inner2 w0.152: v1(22.73,70.66) 27.94,75.87 36.63,75.87 41.78,70.71 43,70.71 47.62,66.09 51.77,66.09 56.01,61.85 60.47,61.85 H1.9
PD13: length 48.7
  Top Layer w0.152: U6.60 21.19,68.63 v1(21.97,69.42)
  Inner2 w0.152: H1.10 55.67,63.13 52.04,66.75 47.93,66.75 43.15,71.53 41.83,71.53 37.08,76.28 27.38,76.28 21.95,70.84 21.95,69.44 v1(21.97,69.42)
PD14: length 45.1
  Top Layer w0.152: U6.61 20.69,66.51 20.9,66.29 25.86,66.29 26.34,66.78 38.89,66.78 40.89,64.77 48.21,64.77 v1(49.53,63.45)
  Bottom Layer w0.152: H1.7 60.47,64.39 58.12,64.39 56.54,62.81 50.16,62.81 v1(49.53,63.45)
PD15: length 47.7
  Top Layer w0.152: v1(20.98,69.29) 20.19,68.5 U6.62
  Inner2 w0.152: H1.8 56.77,68.1 v1(55.63,68.1)
  Bottom Layer w0.152: v1(20.98,69.29) 20.98,70.87 23.14,73.03 30.2,73.03 32.36,75.18 36.37,75.18 43.46,68.1 v1(55.63,68.1)
PE0: length 14.2
  Top Layer w0.152: H2.23 4.4,45.35 10.03,50.98 10.03,54.41 10.99,55.37 U6.97
PE1: length 18.1
  Top Layer w0.152: H2.24 1.7,45.35 2.92,44.12 4.7,44.12 5.33,44.76 5.33,45.64 10.54,50.85 10.54,54.28 11.13,54.87 U6.98
PE2: length 14
  Top Layer w0.152: H2.25 5.84,44.58 5.84,45.39 12.77,52.32 U6.1
PE3: length 19.2
  Top Layer w0.152: H2.26 2.75,41.58 4.57,41.58 5.33,42.34 5.33,43.23 6.48,44.37 6.48,45.14 12.06,50.72 13.72,50.72 14.19,51.19 U6.2
PE4: length 17.3
  Top Layer w0.152: H2.27 5.84,42.04 5.84,42.98 6.98,44.12 6.98,44.77 12.43,50.22 13.84,50.22 14.69,51.06 U6.3
PE5: length 21.3
  Top Layer w0.152: U6.4 15.19,50.54 v1(14.73,50.09)
  Bottom Layer w0.152: H2.28 2.75,39.04 4.7,39.04 5.33,39.68 5.33,40.69 v1(14.73,50.09)
PE6: length 19.4
  Top Layer w0.152: v1(15.49,50.09) 15.69,50.28 U6.5
  Bottom Layer w0.152: v1(15.49,50.09) 5.84,40.44 5.84,39.5 H2.29
PE7: length 44.8
  Top Layer w0.152: U6.38 v1(25.4,59.87)
  Inner2 w0.152: v1(25.4,59.87) 25.65,59.61 35.18,59.61 57.07,37.73 H1.30
PE8: length 43.9
  Top Layer w0.152: v1(28.8,60.38) 27.24,60.38 U6.39
  Inner2 w0.152: v1(28.8,60.38) 29.06,60.12 35.48,60.12 56.62,38.99 60.47,38.99 H1.27
PE9: length 47.7
  Top Layer w0.152: U6.40 27.22,60.88 v1(23.75,60.88)
  Inner2 w0.152: v1(23.75,60.88) 23.95,61.09 29.06,61.09 29.49,60.66 35.76,60.66 56.15,40.27 H1.28
PE10: length 57.9
  Top Layer w0.152: v1(29.97,61.29) 25.15,61.29 24.87,61.57 24.23,61.57 v1(23.57,62.23)
  Inner2 w0.152: H1.25 60.49,41.55 55.6,41.55 35.87,61.29 v1(29.97,61.29) ; v1(23.57,62.23) 23.57,62.37 v1(16.17,69.77)
PE11: length 43
  Top Layer w0.152: U6.42 27.22,61.85 v1(25.81,61.85)
  Inner2 w0.152: v1(25.81,61.85) 26.03,61.62 29.18,61.62 29.49,61.93 35.97,61.93 55.09,42.81 H1.26
PE12: length 60.9
  Top Layer w0.152: 24.61,62.1 23.44,63.27 v1(23.44,63.42) ; U6.43 27.25,62.36 v1(28.8,62.36) ; 27.24,62.42 27.22,62.43 25.25,62.43 24.92,62.1 24.71,62.1
  Inner2 w0.152: H1.23 60.52,44.12 55.7,44.12 37.47,62.36 v1(28.8,62.36) ; v1(23.44,63.42) 17.63,69.24 17.63,69.37 16.27,70.73 15.76,70.73 15.39,71.09 15.39,72.6 v1(16.12,73.33)
PE13: length 44.6
  Top Layer w0.152: U6.44 24.69,62.87 v1(24.64,62.92)
  Inner2 w0.152: v1(24.64,62.92) 24.84,63.12 28.98,63.12 29.34,62.76 37.92,62.76 55.34,45.35 H1.24
PE14: length 43.2
  Top Layer w0.152: v1(29.84,63.37) 27.24,63.37 U6.45
  Inner2 w0.152: v1(29.84,63.37) 31.32,64.85 36.83,64.85 55.07,46.61 60.47,46.61 H1.21
PE15: length 56.3
  Top Layer w0.152: U6.46 v1(25.4,63.87)
  Inner2 w0.152: v1(16.12,71.55) 23.8,63.87 v1(25.4,63.87) 25.78,63.49 28.97,63.49 30.91,65.43 37.19,65.43 54.73,47.89 H1.22
$1N1693: length 18
  Top Layer w0.152: U6.13 19.69,48.57 20.83,47.42 X2.2
  Bottom Layer w0.152: 30.86,39.29 29.72,40.44 29.72,41.45 v1(23.88,47.3)
  vias: v1(30.86,39.36)
$1N1695: length 13.8
  Top Layer w0.152: C4.1 13.71,47.36 X2.1 15.11,47.42 19.18,51.49 19.18,52.31 U6.12
$1N1697: length 32.6
  Top Layer w0.152: C5.2 21.46,30.85 21.46,33.07 23.35,34.96 v1(23.35,35.61) ; v1(16.76,55.04) 17.69,54.12 U6.9
  Inner2 w0.152: v1(16.76,43.99) v1(16.76,55.04)
  Bottom Layer w0.152: v1(16.76,43.99) 23.35,37.41 v1(23.35,35.61)
$1N1698: length 29.1
  Top Layer w0.152: C3.2 20.7,35.46 v1(20.85,35.61) ; v1(16.13,54.28) 17.19,53.22 U6.8
  Inner2 w0.152: v1(16.13,43.36) v1(16.13,54.28)
  Bottom Layer w0.152: v1(20.85,35.61) 20.85,38.64 v1(16.13,43.36)
$1N1844: length 32.5
  Top Layer w0.152: v1(23.27,50.93) 23.69,51.35 U6.21
  Bottom Layer w0.152: v1(42.23,29.9) 32.26,39.88 32.26,41.68 28.85,45.09 v1(27.31,45.09) 25.73,46.66 25.73,50.42 25.22,50.93 v1(23.27,50.93)
$1N1845: length 23.5
  Top Layer w0.152: v1(43.43,72.31) 42.23,71.11 C7.2 ; U6.49 29.3,65.37 v1(30.99,63.68)
  Inner1 w0.152: v1(30.99,63.68) 32.38,65.08 36.19,65.08 v1(43.43,72.31)
$1N1846: length 11.5
  Top Layer w0.152: v1(10.41,70.79) 10.41,69.52 10.87,69.06 13.92,69.06 14.69,68.29 U6.73
  Inner2 w0.152: v1(9.51,66.57) 10.41,67.47 v1(10.41,70.79)
$1N3154: length 12.5
  Top Layer w0.254: USB1.7 37.47,72.86 37.47,72.23 arc(37.49,72.08) 37.58,71.96 37.61,71.92 arc(37.74,71.84) 37.88,71.81 38.07,71.81 arc(38.21,71.83) 38.34,71.92 38.36,71.94 arc(38.44,72.06) 38.47,72.21 USB1.5 38.47,73.82 37.9,74.4 v1(35.69,74.4)
  Bottom Layer w0.152: v1(33.68,69.48) 33.68,70.89 35.69,72.9 v1(35.69,74.4)
$1N3155: length 6.8
  Top Layer w0.254: USB1.6 37.97,72.86 37.97,73.44 arc(37.94,73.58) 37.86,73.7 37.84,73.73 arc(37.72,73.81) 37.57,73.84 37.37,73.84 arc(37.22,73.81) 37.1,73.73 37.08,73.71 arc(37,73.58) 36.97,73.44 USB1.8 36.97,72.07 36.7,71.81 v1(36.19,71.81)
  Bottom Layer w0.152: v1(36.19,71.81) 36.19,70.14 v1(35.56,69.5)
$1N3177: length 14.4
  Inner2 w0.152: v1(39.37,34.43) 37,34.43 34.54,36.88 32.13,36.88 28.96,40.06 v1(27.28,40.06)
$1N3189: length 8.8
  Bottom Layer w0.152: P1.8 28.07,21.01 29.21,22.15 29.21,25.58 v1(26.67,28.12)
$1N3192: length 6.1
  Top Layer w0.152: R18.2 48.89,23.32 LED5.1
$1N3201: length 8.4
  Bottom Layer w0.152: v1(24.89,28.13) 26.67,26.35 26.67,22.28 P1.10
$1N5487: length 2.4
  Top Layer w0.152: LED4.3 R3.2
$1N5507: length 2.5
  Top Layer w0.152: LED4.1 14.44,73.15 R7.2
$1N5508: length 2.5
  Top Layer w0.152: LED4.5 14.44,69.95 R2.2
$1N15506: length 22.8
  Top Layer w0.152: C22.2 33.35,45.5 33.35,56.95
  Top Layer w0.355: OLED1.2 33.35,56.95
$1N15507: length 21.1
  Top Layer w0.152: C22.1 34.05,46.2 34.05,56.95
  Top Layer w0.355: OLED1.3 34.05,56.95
$1N15508: length 23.4
  Top Layer w0.152: 34.75,56.93 34.75,46.9 C23.2
  Top Layer w0.355: OLED1.4 34.75,56.93
$1N15509: length 21.7
  Top Layer w0.152: C23.1 35.45,47.6 35.45,56.94
  Top Layer w0.355: OLED1.5 35.45,56.94
$1N15524: length 26
  Top Layer w0.152: v1(51.87,54.71) 51.55,55.03 51.55,56.75
  Top Layer w0.355: OLED1.28 51.55,56.75
  Bottom Layer w0.152: v1(51.87,54.71) 51.82,54.71 37.86,40.76 v1(36.7,40.76)
$1N15525: length 27.3
  Top Layer w0.152: 50.85,56.77 50.85,55.78 v1(50.72,55.65)
  Top Layer w0.355: OLED1.27 50.85,56.77
  Bottom Layer w0.152: v1(33.66,40.76) 35.83,40.76 v1(50.72,55.65)
$1N15526: length 43.2
  Top Layer w0.152: R25.2 23.82,38.19 23.82,41.76 25.73,43.66 v1(33.05,43.66) ; v1(50.09,56.31) 50.15,56.37 50.15,56.84
  Top Layer w0.355: OLED1.26 50.15,56.84
  Bottom Layer w0.152: v1(33.05,43.66) 37.44,43.66 v1(50.09,56.31)
$1N15542: length 52.4
  Top Layer w0.152: v1(52.45,30.52) R22.1 56.11,31.64 56.11,60.12 53.85,62.38 43.05,62.38 42.45,61.78 OLED1.15
  Top Layer w0.355: OLED1.15 42.45,56.85 42.44,56.85
$1N15550: length 29.3
  Top Layer w0.152: 41.75,56.85 41.75,44.96 D2.2 45.05,41.75 v1(45.75,42.44) ; v1(44.96,36.06) 47.19,36.06 R24.1
  Top Layer w0.355: OLED1.14 41.75,56.85
  Inner1 w0.152: v1(44.96,36.06) 44.96,41.66 v1(45.75,42.44)
$1N15594: length 12.5
  Top Layer w1.016: U7.3 14.06,24.52 U7.4 17.69,21.9 F1.1

## Copper pours and planes (outline as drawn; the poured copper is in the pictures)
GND on Top Layer: -10.26,90.27 73.94,90.27 73.94,0.25 -10.26,0.25
GND on Bottom Layer: -14.94,94.74 79.3,94.74 79.3,3.81 -14.94,3.81
GND on Inner1: -5.44,84.58 69.88,84.58 69.88,14.48 -5.44,14.48
GND on Inner2: -18.95,99.49 83.67,99.49 83.67,0.56 -18.95,0.56

Small or netless copper shapes (teardrops, artwork), in the pictures only: 432 on Top Layer, 83 on Bottom Layer, 31 on Inner1, 100 on Inner2

## Text on the board
Top Silkscreen Layer: 陀螺仪
